# EAGLE design JSAM Wemos Mini 2 Relay (EAGLE 7.7.0)
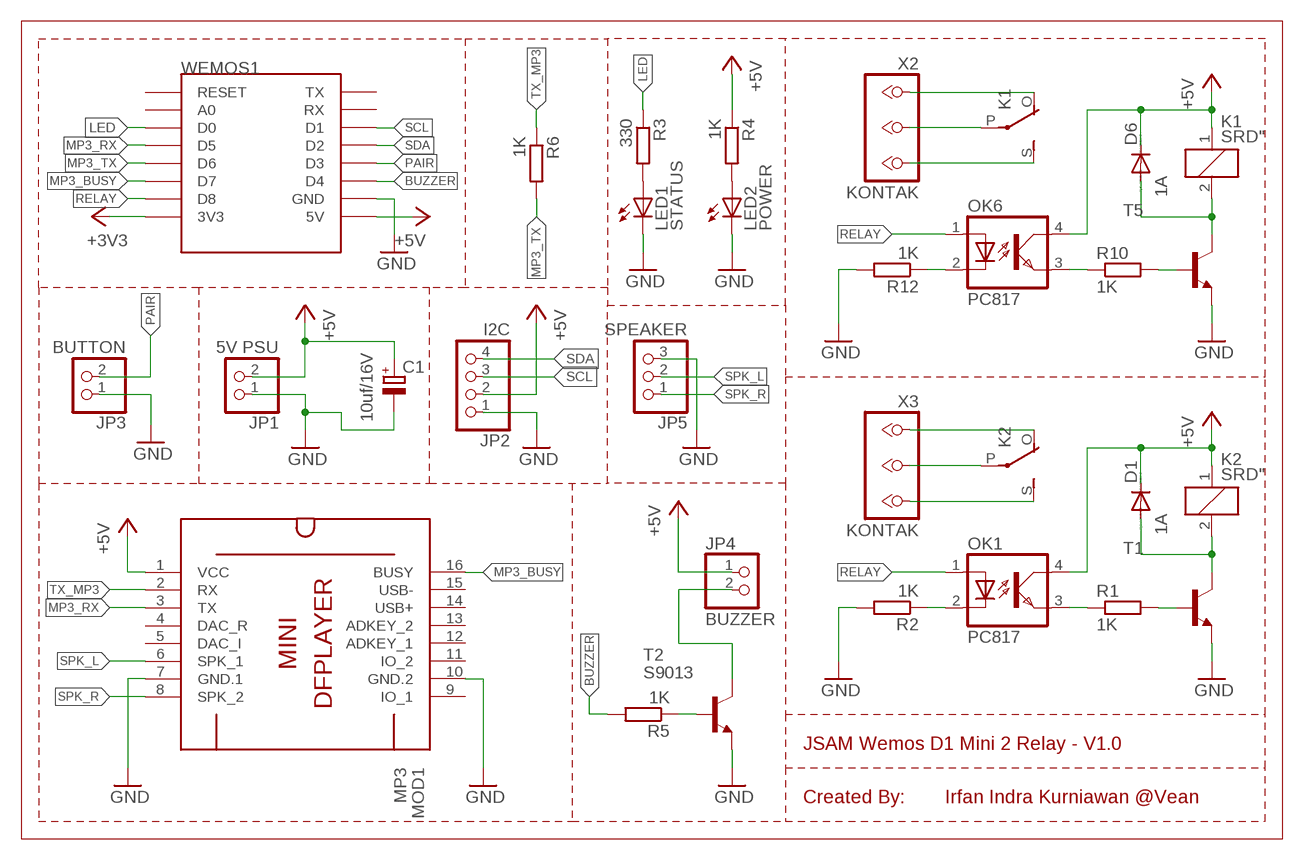
[diagram p0: schematic, sheet 1]

## Parts
C1  10uf/16V  CPOL-EUE2.5-7  [E2,5-7]
D1  1A  DIODE-DIP-1A  [D40-10]
D6  1A  DIODE-DIP-1A  [D40-10]
JP1  5V PSU  PINHD-1X2  [1X02]
JP2  I2C  PINHD-1X4  [1X04]
JP3  BUTTON  PINHD-1X2  [1X02]
JP4  BUZZER  PINHD-1X2  [1X02]
JP5  SPEAKER  PINHD-1X3  [1X03]
K1  SRD"  [SRD]
K2  SRD"  [SRD]
LED1  STATUS  LEDLED3MM  [LED3MM]
LED2  POWER  LEDLED3MM  [LED3MM]
MOD1  MP3  DFPLAYER-MINI-MODULE  [DFPLAYER-MINI-MODULE]
OK1  PC817  [DIL04]
OK6  PC817  [DIL04]
R1  1K  R-EU_0207/7  [0207/7]
R2  1K  R-EU_0207/7  [0207/7]
R3  330  R-EU_0207/10  [0207/10]
R4  1K  R-EU_0207/10  [0207/10]
R5  1K  R-EU_0207/12  [0207/12]
R6  1K  R-EU_0207/12  [0207/12]
R10  1K  R-EU_0207/7  [0207/7]
R12  1K  R-EU_0207/7  [0207/7]
T1  BC317-NPN-TO92-EBC  [TO92-EBC]
T2  S9013  BC317-NPN-TO92-EBC  [TO92-EBC]
T5  BC317-NPN-TO92-EBC  [TO92-EBC]
WEMOS1  WEMOS-D1-MINI  [WEMOS-D1-MINI]
X2  KONTAK  3PIN-SCREW  [KL3]
X3  KONTAK  3PIN-SCREW  [KL3]

## Nets
+3V3: WEMOS1.3V3
+5V: C1.+ D1.C D6.C JP1.2 JP2.2 JP4.1 K1.1 K2.1 MOD1.1(VCC) OK1.4(COL) OK6.4(COL) R4.1 WEMOS1.5V
BUZZER: R5.2 WEMOS1.D4
GND: C1.- JP1.1 JP2.1 JP3.1 JP5.3 LED1.K(C) LED2.K(C) MOD1.7(GND.1) MOD1.10(GND.2) R2.2 R12.2 T1.E T2.E T5.E WEMOS1.GND
LED: R3.1 WEMOS1.D0
MP3_BUSY: MOD1.16(BUSY) WEMOS1.D7
MP3_RX: MOD1.3(TX) WEMOS1.D5
MP3_TX: R6.2 WEMOS1.D6
N$1: K1.P(COM) X2.2
N$2: K1.O(NC) X2.1
N$3: K1.S(NO) X2.3
N$4: R1.2 T1.B
N$5: OK1.3(EMIT) R1.1
N$6: OK1.2(C) R2.1
N$7: D1.A K2.2 T1.C
N$8: K2.O(NC) X3.1
N$9: K2.P(COM) X3.2
N$10: K2.S(NO) X3.3
N$11: LED1.A R3.2
N$16: LED2.A R4.2
N$17: JP4.2 T2.C
N$18: R5.1 T2.B
N$21: R10.2 T5.B
N$22: OK6.3(EMIT) R10.1
N$23: OK6.2(C) R12.1
N$24: D6.A K1.2 T5.C
PAIR: JP3.2 WEMOS1.D3
RELAY: OK1.1(A) OK6.1(A) WEMOS1.D8
SCL: JP2.3 WEMOS1.D1
SDA: JP2.4 WEMOS1.D2
SPK_L: JP5.2 MOD1.6(SPK_1)
SPK_R: JP5.1 MOD1.8(SPK_2)
TX_MP3: MOD1.2(RX) R6.1
Unconnected: MOD1.4(DAC_R) MOD1.5(DAC_I) MOD1.9(IO_1) MOD1.11(IO_2) MOD1.12(ADKEY_1) MOD1.13(ADKEY_2) MOD1.14(USB+) MOD1.15(USB-) WEMOS1.A0 WEMOS1.RESET WEMOS1.RX WEMOS1.TX

## Notes on the sheet
- JSAM Wemos D1 Mini 2 Relay - V1.0
- Created By: | Irfan Indra Kurniawan @Vean

## Library data of the parts
C1 = FansElectronics-RCL:CPOL-EU: POLARIZED CAPACITOR, European symbol
D1 D6 = FansElectronics-Diode:DIODE-DIP
JP1 JP3 JP4 = FansElectronics-Header:PINHD-1X2: PIN HEADER
JP2 = FansElectronics-Header:PINHD-1X4: PIN HEADER
JP5 = FansElectronics-Header:PINHD-1X3: PIN HEADER
K1 K2 = FansElectronics-Relay:SRD
LED1 LED2 = FansElectronics-LED:LED: LED : Tersedia berbagai ukuran dari DIL dan SMD
MOD1 = diy-modules:DFPLAYER-MINI-MODULE: DFPlayer Mini - MP3 player module based on YX5200 chip More details available here: https://www.dfrobot.com/wiki/index.php/DFPlayer_Mini_SKU:DFR0299 Click here to find device on ebay.com <http://www.ebay.com/sch/dfplayer+mini>
OK1 OK6 = optocoupler:PC817: SHARP OPTO COUPLER; MPN: PC817X4J000F; OC_FARNELL: 9707727; OC_NEWARK: 97K7059
R1-R6 R10 R12 = FansElectronics-RCL:R-EU_: RESISTOR, European symbol
T1 T2 T5 = transistor:*-NPN-: NPN Transistror BF959 corrected 2008.03.06
WEMOS1 = esp8266modules:WEMOS-D1-MINI: WeMos.cc D1 mini ESP8266 module
X2 X3 = FansElectronics-Con-Screw:3PIN

## Board
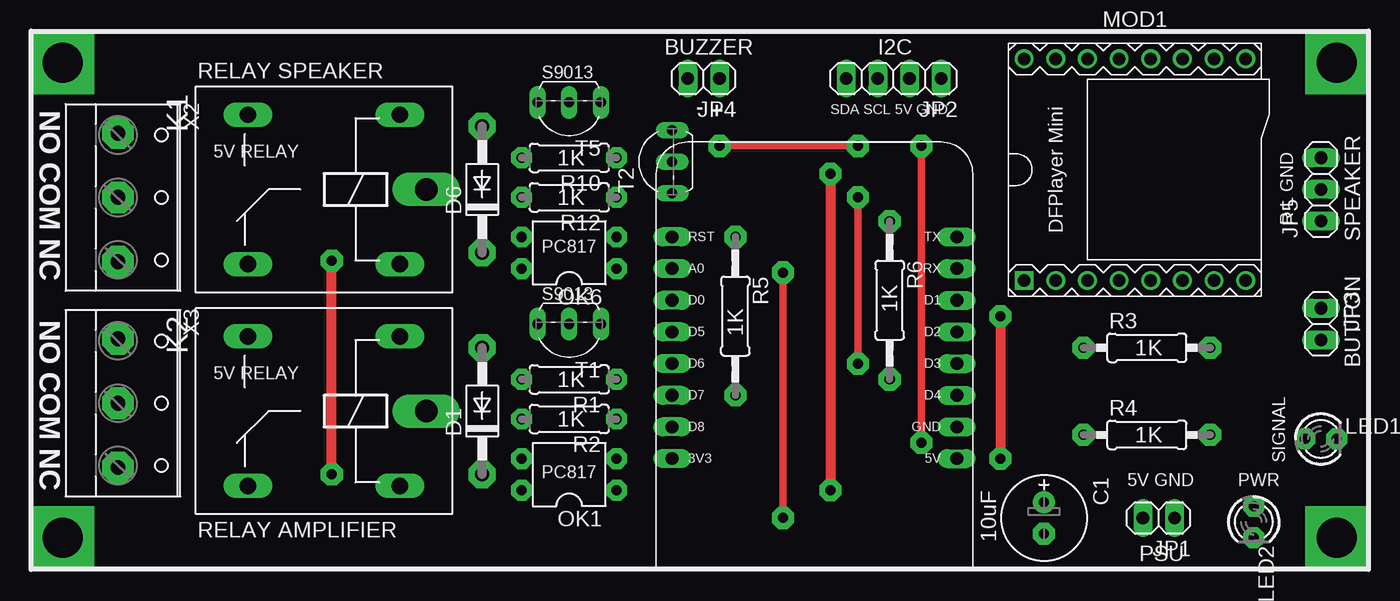
[diagram p1: board, top side]
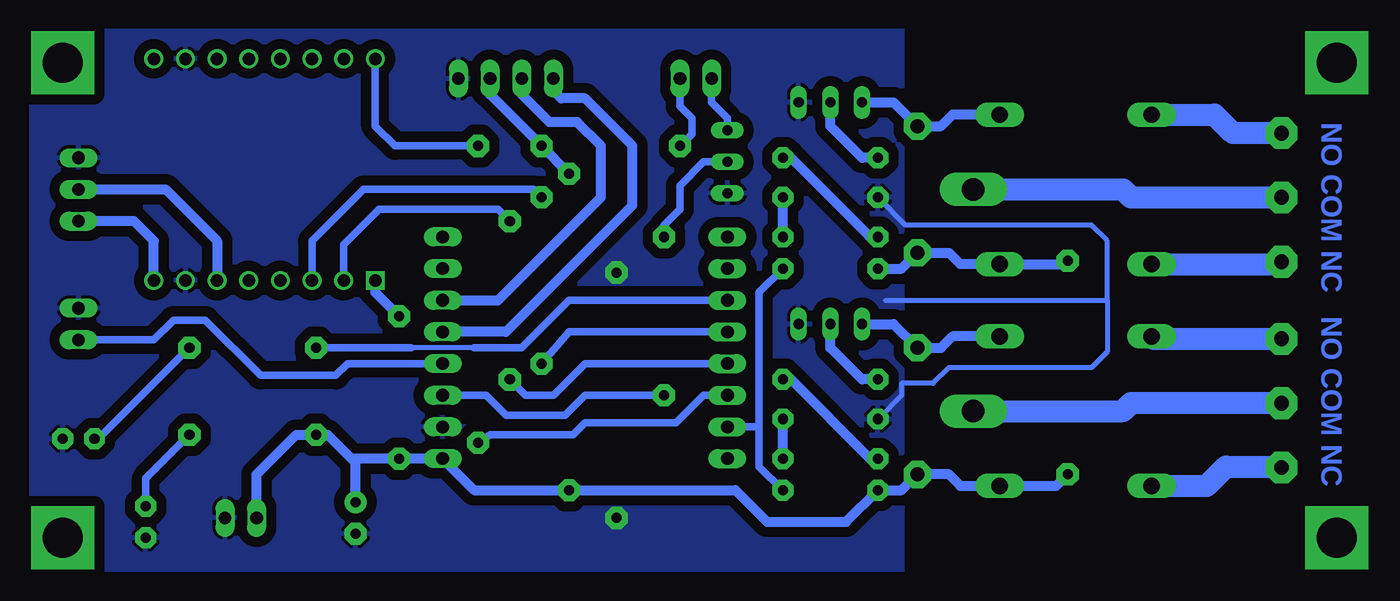
[diagram p2: board, bottom side, seen from below]

No outline drawn. Coordinates in mm, seen from the top.
Copper layers (1*16): Top 0.035mm / dielectric 1.5mm / Bottom 0.035mm
Design rules "default": minimum track width 10mil, minimum drill 24mil, track to track 8mil, track to pad 8mil, pad to pad 8mil, via to via 8mil, smd to smd 8mil, copper to edge 40mil, drill to drill 8mil, minimum pad ring 10mil, minimum via ring 8mil, stop-mask expansion 4mil, vias tented up to drill 0mil, thermal gap 10mil
bRestrict: area -13.3,30.5 to 22.9,73.7

### Footprints (pad centres in the part's own frame; a part is rotated, then mirrored left to right if it is on the bottom)
E2,5-7 = drill 0.813 pad 1.778: + -1.27,0 | drill 0.813 pad 1.778 octagon: - 1.27,0
D40-10 = drill 1.118 pad 2.184 octagon: A 5.08,0; C -5.08,0
1X02 = drill 1.016 long: 1 -1.27,0; 2 1.27,0
1X04 = drill 1.016 long: 1 -3.81,0; 2 -1.27,0; 3 1.27,0; 4 3.81,0
1X03 = drill 1.016 long: 1 -2.54,0; 2 0,0; 3 2.54,0
SRD = drill 1.321 long: 1 -6.096,5.994; 2 -6.096,-5.994; O 6.096,5.994; S 6.096,-5.994 | drill 1.803 long: P -8.204,0
LED3MM = drill 0.813 pad 1.676 octagon: A -1.27,0; K 1.27,0
DFPLAYER-MINI-MODULE = drill 1 square: 1 -8.89,-8.89 | drill 1: 2 -6.35,-8.89; 3 -3.81,-8.89; 4 -1.27,-8.89; 5 1.27,-8.89; 6 3.81,-8.89; 7 6.35,-8.89; 8 8.89,-8.89; 9 8.89,8.89; 10 6.35,8.89; 11 3.81,8.89; 12 1.27,8.89; 13 -1.27,8.89; 14 -3.81,8.89; 15 -6.35,8.89; 16 -8.89,8.89
DIL04 = drill 0.813 pad 1.676 octagon: 1 -1.27,-3.81; 2 1.27,-3.81; 3 1.27,3.81; 4 -1.27,3.81
0207/7 = drill 0.813 pad 1.676 octagon: 1 -3.81,0; 2 3.81,0
0207/10 = drill 0.813 pad 1.778 octagon: 1 -5.08,0; 2 5.08,0
0207/12 = drill 0.813 pad 1.778 octagon: 1 -6.35,0; 2 6.35,0
TO92-EBC = drill 0.813 long: B 0,-1.27; C 2.54,-1.27; E -2.54,-1.27
WEMOS-D1-MINI = drill 1.016 long: 3V3 -11.43,-8.89; 5V 11.43,-8.89; A0 -11.43,6.35; D0 -11.43,3.81; D1 11.43,3.81; D2 11.43,1.27; D3 11.43,-1.27; D4 11.43,-3.81; D5 -11.43,1.27; D6 -11.43,-1.27; D7 -11.43,-3.81; D8 -11.43,-6.35; GND 11.43,-6.35; RESET -11.43,8.89; RX 11.43,6.35; TX 11.43,8.89
KL3 = drill 1.194 pad 2.54 octagon: 1 5.16,-1.29; 2 0,-1.29; 3 -5.16,-1.29

### Placement (x,y rotation side)
C1  67.94,34.61 270 top
D1  22.86,43.18 90 top
D6  22.86,60.96 90 top
JP1  77.15,34.61 180 top
JP2  55.88,69.85 180 top
JP3  90.17,50.16 270 top
JP4  40.64,69.85 180 top
JP5  90.17,60.96 90 top
K1  10.16,60.96 180 top
K2  10.16,43.18 180 top
LED1  90.17,40.96 0 top
LED2  84.77,34.29 270 top
MOD1  75.25,62.55 0 top
OK1  29.84,38.1 90 top
OK6  29.84,55.88 90 top
R1  29.84,45.72 180 top
R2  29.84,42.55 180 top
R3  76.2,48.26 0 top
R4  76.2,41.27 0 top
R5  43.18,50.8 270 top
R6  55.56,52.07 270 top
R10  29.84,63.5 180 top
R12  29.84,60.33 180 top
T1  29.84,48.9 180 top
T2  36.83,63.18 90 top
T5  29.84,66.67 180 top
WEMOS1  49.53,48.26 0 top
X2  -5.08,60.33 270 top
X3  -5.08,43.81 270 top

### Tracks (layer width: path | path; a pad name or v marks a point on that pad's centre or on a via)
+5V  (via drill 0.8 pad 1.78)
  Top 0.61: v41.91,64.45 v53.02,64.45
  Top 0.813: v50.8,62.23 v50.8,36.83 | v10.79,38.1 v10.79,55.24 | v64.45,50.8 v64.45,39.37
  Bottom 0.61: JP4.1 41.91,67.63 40.96,66.67 40.96,65.41 v41.91,64.45
  Bottom 0.813: OK6.4 24.13,54.61 D6.C 20.32,55.88 19.41,54.97 K1.1 11.07,54.97 v10.79,55.24 | v10.79,38.1 11.71,37.19 K2.1 19.41,37.19 20.32,38.1 D1.C 24.13,36.83 OK1.4 28.57,34.29 34.92,34.29 37.47,36.83 v50.8,36.83 58.42,36.83 WEMOS1.5V v64.45,39.37 68.26,39.37 | v50.8,62.23 v53.02,64.45 57.15,68.58 JP2.2 | MOD1.1 66.36,52.7 v64.45,50.8 | 68.26,39.37 70.17,41.27 R4.1 72.71,41.27 75.88,38.1 JP1.2 | C1.+ 67.94,39.05 68.26,39.37
BUZZER
  Bottom 0.61: WEMOS1.D4 57.47,44.45 55.88,42.86 51.12,42.86 49.53,44.45 R5.2
GND  (via drill 0.8 pad 1.78)
  Top 0.61: v46.99,34.61 v46.99,54.29
  Bottom 0.406: 25.4,52.07 7.62,52.07 | 7.62,52.07 7.62,56.83 8.89,58.1 23.81,58.1 R12.2 | 7.62,52.07 7.62,47.94 8.89,46.67 20.32,46.67 21.59,45.4 24.13,45.4 24.13,44.45 R2.2
  pour Bottom (isolate 0.813): -13.34,73.66 93.98,73.66 93.98,30.48 -13.34,30.48
LED
  Bottom 0.406: 58.42,48.26 63.5,48.26
  Bottom 0.61: WEMOS1.D0 50.8,52.07 54.61,48.26 58.42,48.26 | 63.5,48.26 R3.1
MP3_BUSY  (via drill 0.8 pad 1.78)
  Top 0.61: v58.1,40.64 v58.1,64.45
  Bottom 0.61: WEMOS1.D7 40.01,44.45 42.23,42.23 49.53,42.23 50.48,41.27 57.15,41.27 v58.1,40.64 | v58.1,64.45 64.77,64.45 66.36,66.04 MOD1.16
MP3_RX  (via drill 0.8 pad 1.78)
  Top 0.61: v53.02,60.33 v53.02,46.99
  Bottom 0.61: v53.02,46.99 50.8,49.53 WEMOS1.D5 | v53.02,60.33 53.66,60.96 67.31,60.96 71.44,56.83 MOD1.3
MP3_TX
  Bottom 0.61: R6.2 54.29,44.45 52.07,44.45 49.53,46.99 WEMOS1.D6
N$1
  Bottom 1.778: K1.P 6.35,60.96 5.71,60.33 X2.2
N$2
  Bottom 1.778: K1.O -6.17,54.97 X2.1
N$3
  Bottom 1.778: X2.3 -2.46,65.48 -0.99,66.95 K1.S
N$4
  Bottom 0.813: R1.2 27.3,45.72 29.84,48.26 T1.B
N$5
  Bottom 0.813: OK1.3 26.67,39.37 33.02,45.72 R1.1
N$6
  Bottom 0.813: OK1.2 R2.1
N$7
  Bottom 0.813: T1.C 24.77,50.16 D1.A 20.95,48.26 20.04,49.17 K2.2
N$8
  Bottom 1.778: K2.O -0.36,37.19 -1.91,38.73 -6.29,38.73 X3.1
N$9
  Bottom 1.778: X3.2 5.71,43.81 6.35,43.18 K2.P
N$10
  Bottom 1.778: K2.S 3.87,48.98 X3.3
N$11
  Bottom 0.61: LED1.A 88.58,40.96 R3.2
N$12  (via drill 3.2 pad 5.08)
  other vias: 91.44,71.12
N$13  (via drill 3.2 pad 5.08)
  other vias: -10.79,33.02
N$14  (via drill 3.2 pad 5.08)
  other vias: -10.79,71.12
N$15  (via drill 3.2 pad 5.08)
  other vias: 91.44,33.02
N$16
  Bottom 0.61: LED2.A 84.77,37.78 R4.2
N$17
  Bottom 0.61: T2.C 38.1,66.67 39.37,67.94 JP4.2
N$18
  Bottom 0.61: R5.1 43.18,58.1 41.91,59.37 41.91,61.28 40.01,63.18 T2.B
N$21
  Bottom 0.813: R10.2 27.3,63.5 29.84,66.04 T5.B
N$22
  Bottom 0.813: R10.1 33.02,63.5 26.67,57.15 OK6.3
N$23
  Bottom 0.813: OK6.2 R12.1
N$24
  Bottom 0.813: T5.C 24.77,67.94 D6.A 20.95,66.04 20.04,66.95 K1.2
PAIR
  Bottom 0.61: WEMOS1.D3 68.58,46.99 69.53,46.04 75.56,46.04 80.01,50.48 82.55,50.48 84.14,48.9 JP3.2
RELAY
  Bottom 0.61: 35.56,41.91 35.56,38.73 OK1.1 | 35.56,41.91 WEMOS1.D8 | 35.56,41.91 35.56,52.7 OK6.1
SCL
  Bottom 0.813: WEMOS1.D1 56.52,52.07 48.26,60.33 48.26,64.45 50.16,66.36 52.39,66.36 54.61,68.58 JP2.3
SDA
  Bottom 0.813: WEMOS1.D2 55.88,49.53 45.72,59.69 45.72,64.45 49.53,68.26 51.44,68.26 52.07,68.9 JP2.4
SPK_L
  Bottom 0.813: JP5.2 83.19,60.96 79.06,56.83 MOD1.6
SPK_R
  Bottom 0.813: MOD1.8 84.14,56.83 85.72,58.42 JP5.1
TX_MP3
  Bottom 0.61: R6.1 56.52,59.37 66.04,59.37 68.9,56.52 MOD1.2

### Text on the board
Bottom: NO COM NC | NO COM NC
tPlace: BUZZER | I2C | RELAY SPEAKER | S9013 | + - | NO COM NC | SDA SCL 5V GND | 5V RELAY | 1K | 1K | R L GND | SPEAKER | PC817 | S9013 | 1K | NO COM NC | 1K | 1K | BUTTON | 5V RELAY | 1K | 1K | 1K | SIGNAL | PC817 | 5V GND | PWR | RELAY AMPLIFIER | 10uF | PSU